# Altium schematic sheet PERIPHERA.SchDoc: PERIPHERA
size A4; Revision: V2.0; SheetNumber: 7; SheetTotal: 7; Project: PY32F403v1xT_START
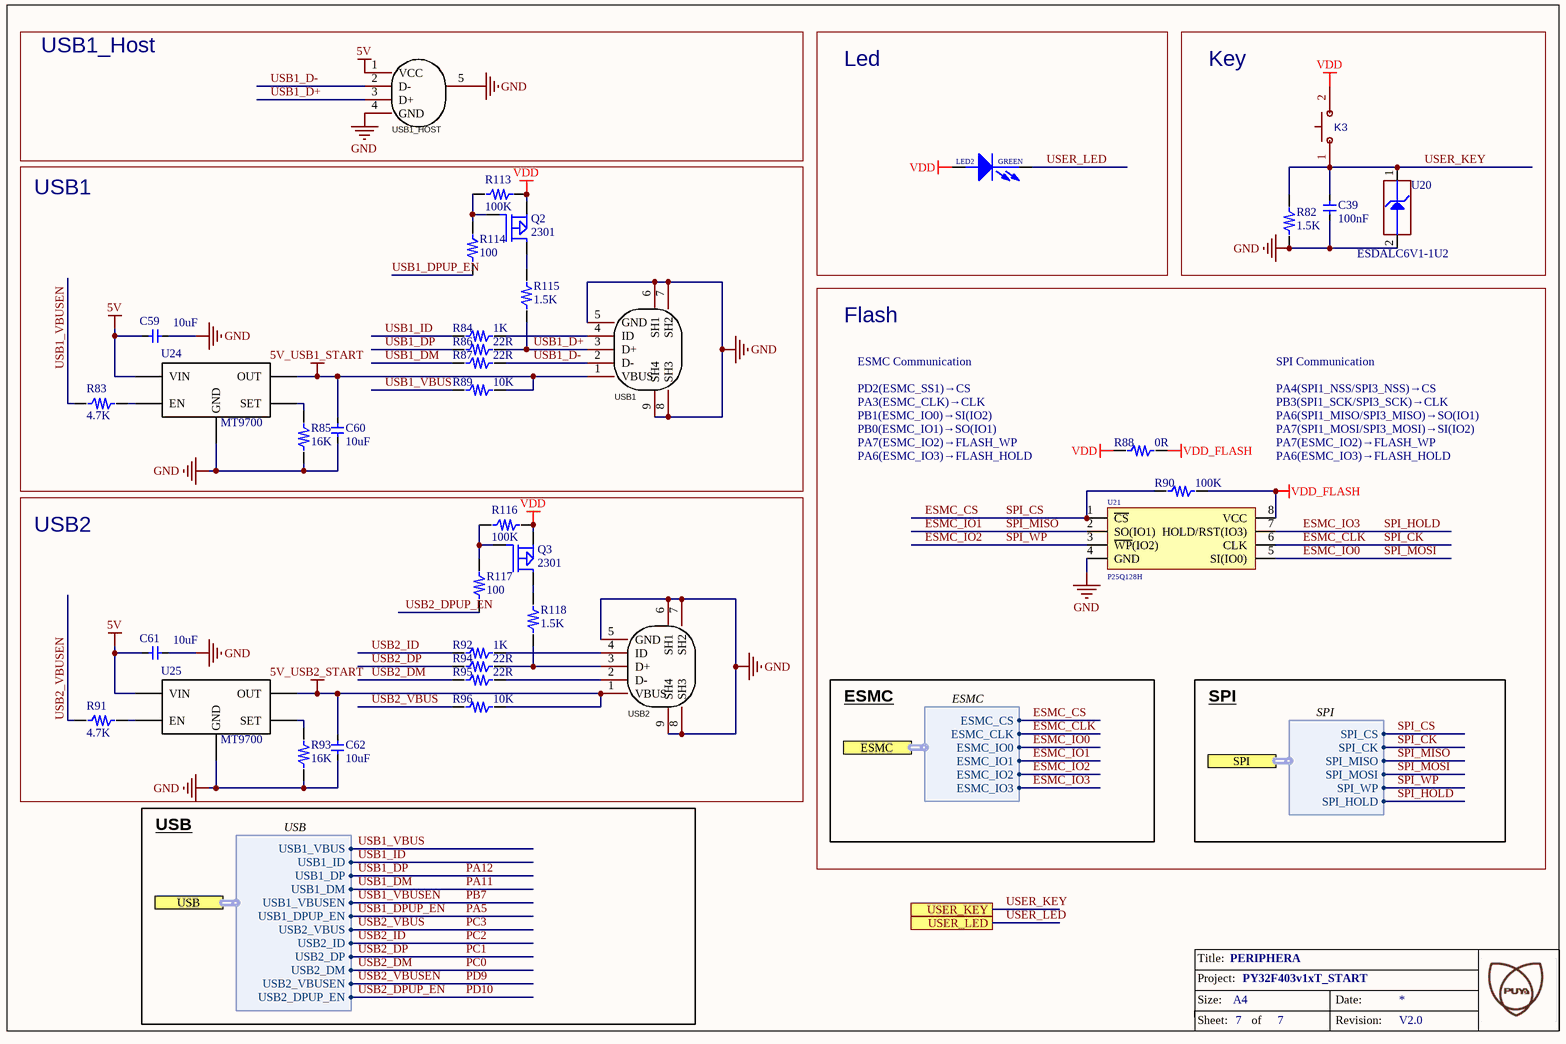
[diagram p0: PERIPHERA.SchDoc]

## Parts
C39  100nF  [C0603]
C59  10uF  [C0805]
C60  10uF  [C0805]
C61  10uF  [C0805]
C62  10uF  [C0805]
K3  1TS002B-2600-5001_key  [Switch]  (value not drawn)
LED2  GREEN  [0603_LED]
Q2  2301  [SOT23 2301]
Q3  2301  [SOT23 2301]
R82  1.5K  [R0603]
R83  4.7K  [R0603]
R84  1K  [R0603]
R85  16K  [R0603]
R86  22R  [R0603]
R87  22R  [R0603]
R88  0R  [R0603]
R89  10K  [R0603]
R90  100K  [R0603]
R91  4.7K  [R0603]
R92  1K  [R0603]
R93  16K  [R0603]
R94  22R  [R0603]
R95  22R  [R0603]
R96  10K  [R0603]
R113  100K  [R0603]
R114  100  [R0603]
R115  1.5K  [R0603]
R116  100K  [R0603]
R117  100  [R0603]
R118  1.5K  [R0603]
U20  value ESDALC6V1-1U2  [ESD_ST0201]  (hidden comment: ESD-TRANSIL)
U21  P25Q128H  [SOP8W_L]
U24  MT9700  [SOT23-5]
U25  MT9700  [SOT23-5]
USB1  Micro-B  [MICRO-USB-SMD_MICROXNJ]  (value not drawn)
USB1_HOST  Type-A  [USB-A-TH_AF-WJDG]  (value not drawn)
USB2  Micro-B  [MICRO-USB-SMD_MICROXNJ]  (value not drawn)

## Blocks framed on the sheet
USB1_Host: USB1_HOST
Led: LED2
Key: C39 K3 R82 U20
USB1: C59 C60 Q2 R83-R87 R89 R113-R115 U24 USB1
Flash: R88 R90 U21
USB2: C61 C62 Q3 R91-R96 R116-R118 U25 USB2

## Ports
ESMC (harness ESMC), SPI (harness SPI), USB (harness USB), USER_KEY, USER_LED

## Harnesses
ESMC: ESMC_IO2, ESMC_IO1, ESMC_IO0, ESMC_CS, ESMC_IO3, ESMC_CLK
SPI: SPI_MOSI, SPI_MISO, SPI_CS, SPI_CK, SPI_WP, SPI_HOLD
USB: USB2_VBUS, USB1_DM, USB1_DP, USB1_VBUS, USB2_ID, USB2_DP, USB2_DM, USB1_ID, USB2_VBUSEN, USB1_VBUSEN, USB1_DPUP_EN, USB2_DPUP_EN

## Nets
5V: C59.2 C61.2 U24.5(VIN) U25.5(VIN) USB1_HOST.1(VCC)
5V_USB1_START: C60.2 R89.2 U24.1(OUT) USB1.1(VBUS)
5V_USB2_START: C62.2 R96.2 U25.1(OUT) USB2.1(VBUS)
GND: C39.1 C59.1 C60.1 C61.1 C62.1 R82.1 R85.1 R93.1 U20.2(GND) U21.4(GND) U24.2(GND) U25.2(GND) USB1.5(GND) USB1.6(SH1) USB1.7(SH2) USB1.8(SH3) USB1.9(SH4) USB1_HOST.4(GND) USB1_HOST.5(SHLD) USB2.5(GND) USB2.6(SH1) USB2.7(SH2) USB2.8(SH3) USB2.9(SH4)
VDD: K3.2(B) LED2.1(ANODE) Q2.2(S) Q3.2(S) R88.1 R113.1 R116.1
VDD_FLASH: R88.2 R90.2 U21.8(VCC)
ESMC_CLK: U21.6(CLK) ; port ESMC.ESMC_CLK, port SPI.SPI_CK  [also labelled SPI_CK]
ESMC_CS: R90.1 U21.1(~{CS}) ; port ESMC.ESMC_CS, port SPI.SPI_CS  [also labelled SPI_CS]
ESMC_IO0: U21.5(SI(IO0)) ; port ESMC.ESMC_IO0, port SPI.SPI_MOSI  [also labelled SPI_MOSI]
ESMC_IO1: U21.2(SO(IO1)) ; port ESMC.ESMC_IO1, port SPI.SPI_MISO  [also labelled SPI_MISO]
ESMC_IO2: U21.3(~{WP}(IO2)) ; port ESMC.ESMC_IO2, port SPI.SPI_WP  [also labelled SPI_WP]
ESMC_IO3: U21.7(HOLD/RST(IO3)) ; port ESMC.ESMC_IO3, port SPI.SPI_HOLD  [also labelled SPI_HOLD]
PA5: R114.2 ; port USB.USB1_DPUP_EN  [also labelled USB1_DPUP_EN]
PA11: R87.1 ; port USB.USB1_DM  [also labelled USB1_DM]
PA12: R86.1 ; port USB.USB1_DP  [also labelled USB1_DP]
PB7: R83.1 ; port USB.USB1_VBUSEN  [also labelled USB1_VBUSEN]
PC0: R95.1 ; port USB.USB2_DM  [also labelled USB2_DM]
PC1: R94.1 ; port USB.USB2_DP  [also labelled USB2_DP]
PC2: R92.1 ; port USB.USB2_ID  [also labelled USB2_ID]
PC3: R96.1 ; port USB.USB2_VBUS  [also labelled USB2_VBUS]
PD9: R91.1 ; port USB.USB2_VBUSEN  [also labelled USB2_VBUSEN]
PD10: R117.2 ; port USB.USB2_DPUP_EN  [also labelled USB2_DPUP_EN]
USB1_D+: R86.2 R115.1 USB1.3(D+) USB1_HOST.3(D+)
USB1_D-: R87.2 USB1.2(D-) USB1_HOST.2(D-)
USB1_ID: R84.1 ; port USB.USB1_ID
USB1_VBUS: R89.1 ; port USB.USB1_VBUS
USER_KEY: C39.2 K3.1(A) R82.2 U20.1(IO1) ; port USER_KEY
USER_LED: LED2.2(CATHODE) ; port USER_LED
NetQ2_1: Q2.1(G) R113.2 R114.1
NetQ2_3: Q2.3(D) R115.2
NetQ3_1: Q3.1(G) R116.2 R117.1
NetQ3_3: Q3.3(D) R118.2
NetR83_2: R83.2 U24.4(EN)
NetR84_2: R84.2 USB1.4(ID)
NetR85_2: R85.2 U24.3(SET)
NetR91_2: R91.2 U25.4(EN)
NetR92_2: R92.2 USB2.4(ID)
NetR93_2: R93.2 U25.3(SET)
NetR94_2: R94.2 R118.1 USB2.3(D+)
NetR95_2: R95.2 USB2.2(D-)

## Notes on the sheet
- ESMC Communication
- SPI Communication
- PA3(ESMC_CLK)→CLK
- PB0(ESMC_IO1)→SO(IO1)
- PB1(ESMC_IO0)→SI(IO2)
- PD2(ESMC_SS1)→CS
- PA7(ESMC_IO2)→FLASH_WP
- PB3(SPI1_SCK/SPI3_SCK)→CLK
- PA6(SPI1_MISO/SPI3_MISO)→SO(IO1)
- PA7(SPI1_MOSI/SPI3_MOSI)→SI(IO2)
- PA4(SPI1_NSS/SPI3_NSS)→CS
- PA6(ESMC_IO3)→FLASH_HOLD
- ESMC
- SPI
- USB
- Title:
- Project:
- Size:
- Sheet:
- A4
- of
- Date:
- Revision:

## Library data of the parts
C39 = C0603: PCB DECAL: 0603
C59-C62 = C0805: PCB DECAL: 0805
K3 = 1TS002B-2600-5001_key: BOM_Manufacturer: HYP; Contributor: LCSC; BOM_Supplier: LCSC; BOM_Supplier Part: C319334; BOM_Manufacturer Part: 1TS002B-2600-5001_KEY; BOM_JLCPCB Part Class: Extended Part; spicePre: S; spiceSymbolName: 1TS002B-2600-5001
LED2 = PDI-E803_Dup1
Q2 Q3 = MOSFET P: Value: SI2301; 器件封装(外观): SOT23
R82-R96 R113-R118 = R0603: PCB DECAL: 0603
U20 = ESD-TRANSIL: ESD protection 6V1; Internal_Part_Number: MCD-00170; Part_Type: Diode; Manufacturer: STMICROELECTRONICS; ECCN_US: EAR99; ECCN_EU: NEC; Provided_By: Subcon; Initial_Board_Reference: MB1274; Status: Released; Manufacturer_Part_Number: ESDALC6V1-1U2; ComponentLink1Description: STM_ESD_ESDALC6V1-1U2.pdf; ComponentLink1URL: http://tunmcdsvn.tun.st.com/Component_Datasheet_Library/Trunk/Diodes/STM_ESD_ESDALC6V1-1U2
U21 = W25Q256: 外置flash
USB1 USB2 = MicroXNJ: Manufacturer: SHOU HAN(首韩); Add into BOM: yes; Gender: 母; Number of Ports: 1; Number of Contacts: 5P; Current Rating - Power (Max): 1A; Name: MicroXNJ; Symbol: MICROXNJ; Device: MicroXNJ; LCSC Part Name: Micro-B 母 卧贴; Supplier Part: C404969; Manufacturer Part: MicroXNJ; Supplier Footprint: SMD; JLCPCB Part Class: Extended Part; Datasheet: https://atta.szlcsc.com/upload/public/pdf/source/20220415/2494EDFF499AF6F852F7C820374B6AF3.pdf; Supplier: LCSC; Convert to PCB: yes; Connector Type: Micro-B; Standard: USB 2.0; Mounting Style: 卧贴; Operating Temperature Range: -20℃~+85℃
USB1_HOST = AF 90° WJDG: Manufacturer: SHOU HAN(首韩); Add into BOM: yes; Gender: 母; Number of Ports: 1; Number of Contacts: 4P; Current Rating - Power (Max): 1.5A; Name: AF 90° WJDG; Symbol: AF 90° WJDG; Device: AF 90° WJDG; LCSC Part Name: Type-A 母 弯插; Supplier Part: C456018; Manufacturer Part: AF 90° WJDG; Supplier Footprint: 插件; JLCPCB Part Class: Extended Part; Datasheet: https://atta.szlcsc.com/upload/public/pdf/source/20191113/C456018_B104E062BEB8E11E57E63560E04EE13A.pdf; Supplier: LCSC; Convert to PCB: yes; Connector Type: Type-A; Standard: USB 2.0; Mounting Style: 弯插; Operating Temperature Range: -25℃~+85℃